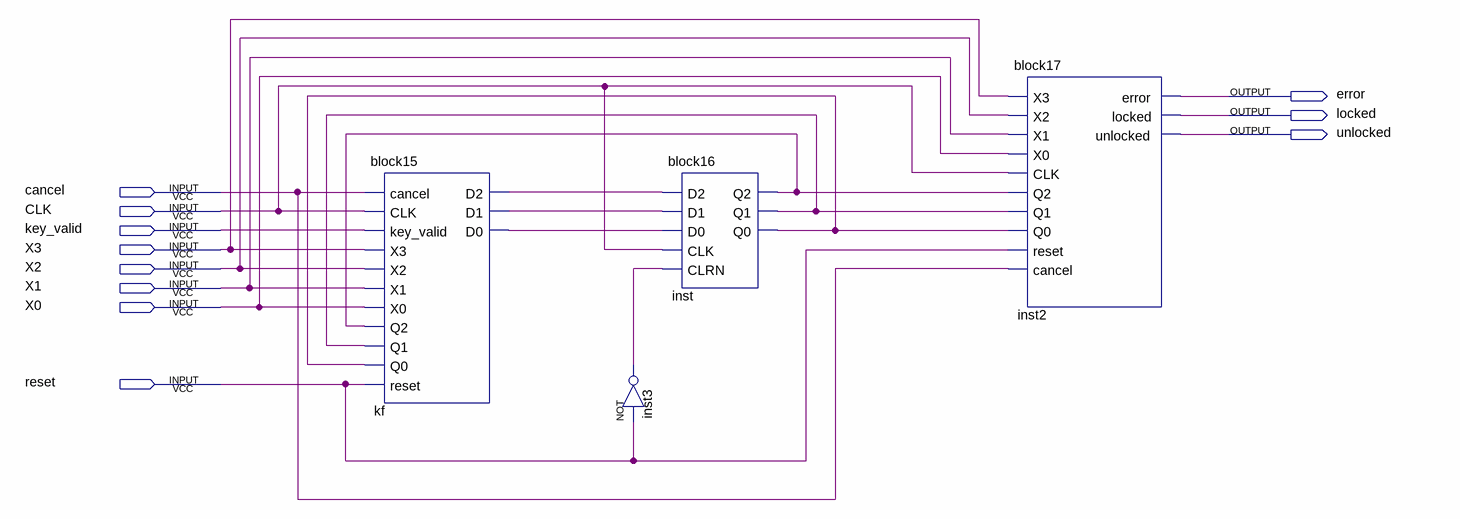
[diagram p0: schematic sheet]
// Quartus schematic block_cuoi.bdf as structural Verilog: 4 symbols, 11 pins
module block_cuoi (
  input  cancel,
  input  CLK,
  input  key_valid,
  input  X3,
  input  X2,
  input  X1,
  input  X0,
  input  reset,
  output error,
  output locked,
  output unlocked
);

  wire inst3_out, inst_q0, inst_q1, inst_q2, kf_d0, kf_d1, kf_d2;

  block15 kf (
    .cancel(cancel), .CLK(CLK), .key_valid(key_valid), .X3(X3), .X2(X2), .X1(X1), .X0(X0), .Q2(inst_q2),
    .Q1(inst_q1), .Q0(inst_q0), .reset(reset), .D2(kf_d2), .D1(kf_d1), .D0(kf_d0));
  not inst3 (inst3_out, reset);
  block16 inst (
    .D2(kf_d2), .D1(kf_d1), .D0(kf_d0), .CLK(CLK), .CLRN(inst3_out), .Q2(inst_q2), .Q1(inst_q1), .Q0(inst_q0));
  block17 inst2 (
    .X3(X3), .X2(X2), .X1(X1), .X0(X0), .CLK(CLK), .Q2(inst_q2), .Q1(inst_q1), .Q0(inst_q0), .reset(reset),
    .cancel(cancel), .error(error), .locked(locked), .unlocked(unlocked));
endmodule
